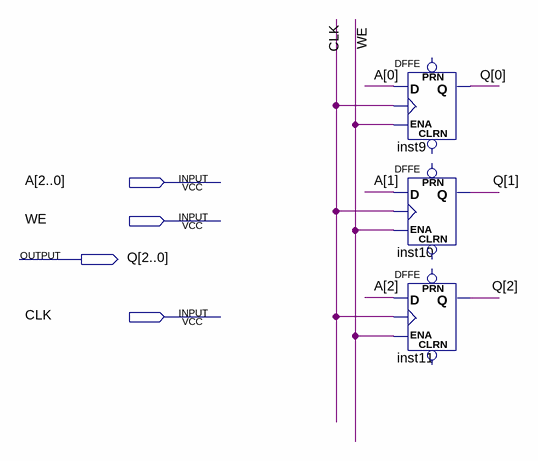
[diagram p0: schematic sheet]
// Quartus schematic 3bit-Register.bdf as structural Verilog: 3 symbols, 4 pins
module \3bit-Register  (
  input  [2:0] A,
  input  WE,
  input  CLK,
  output [2:0] Q
);

  DFFE inst9 (.D(A[0]), .CLK(CLK), .ENA(WE), .Q(Q[0]));  // open: PRN, CLRN
  DFFE inst10 (.D(A[1]), .CLK(CLK), .ENA(WE), .Q(Q[1]));  // open: PRN, CLRN
  DFFE inst11 (.D(A[2]), .CLK(CLK), .ENA(WE), .Q(Q[2]));  // open: PRN, CLRN
endmodule
